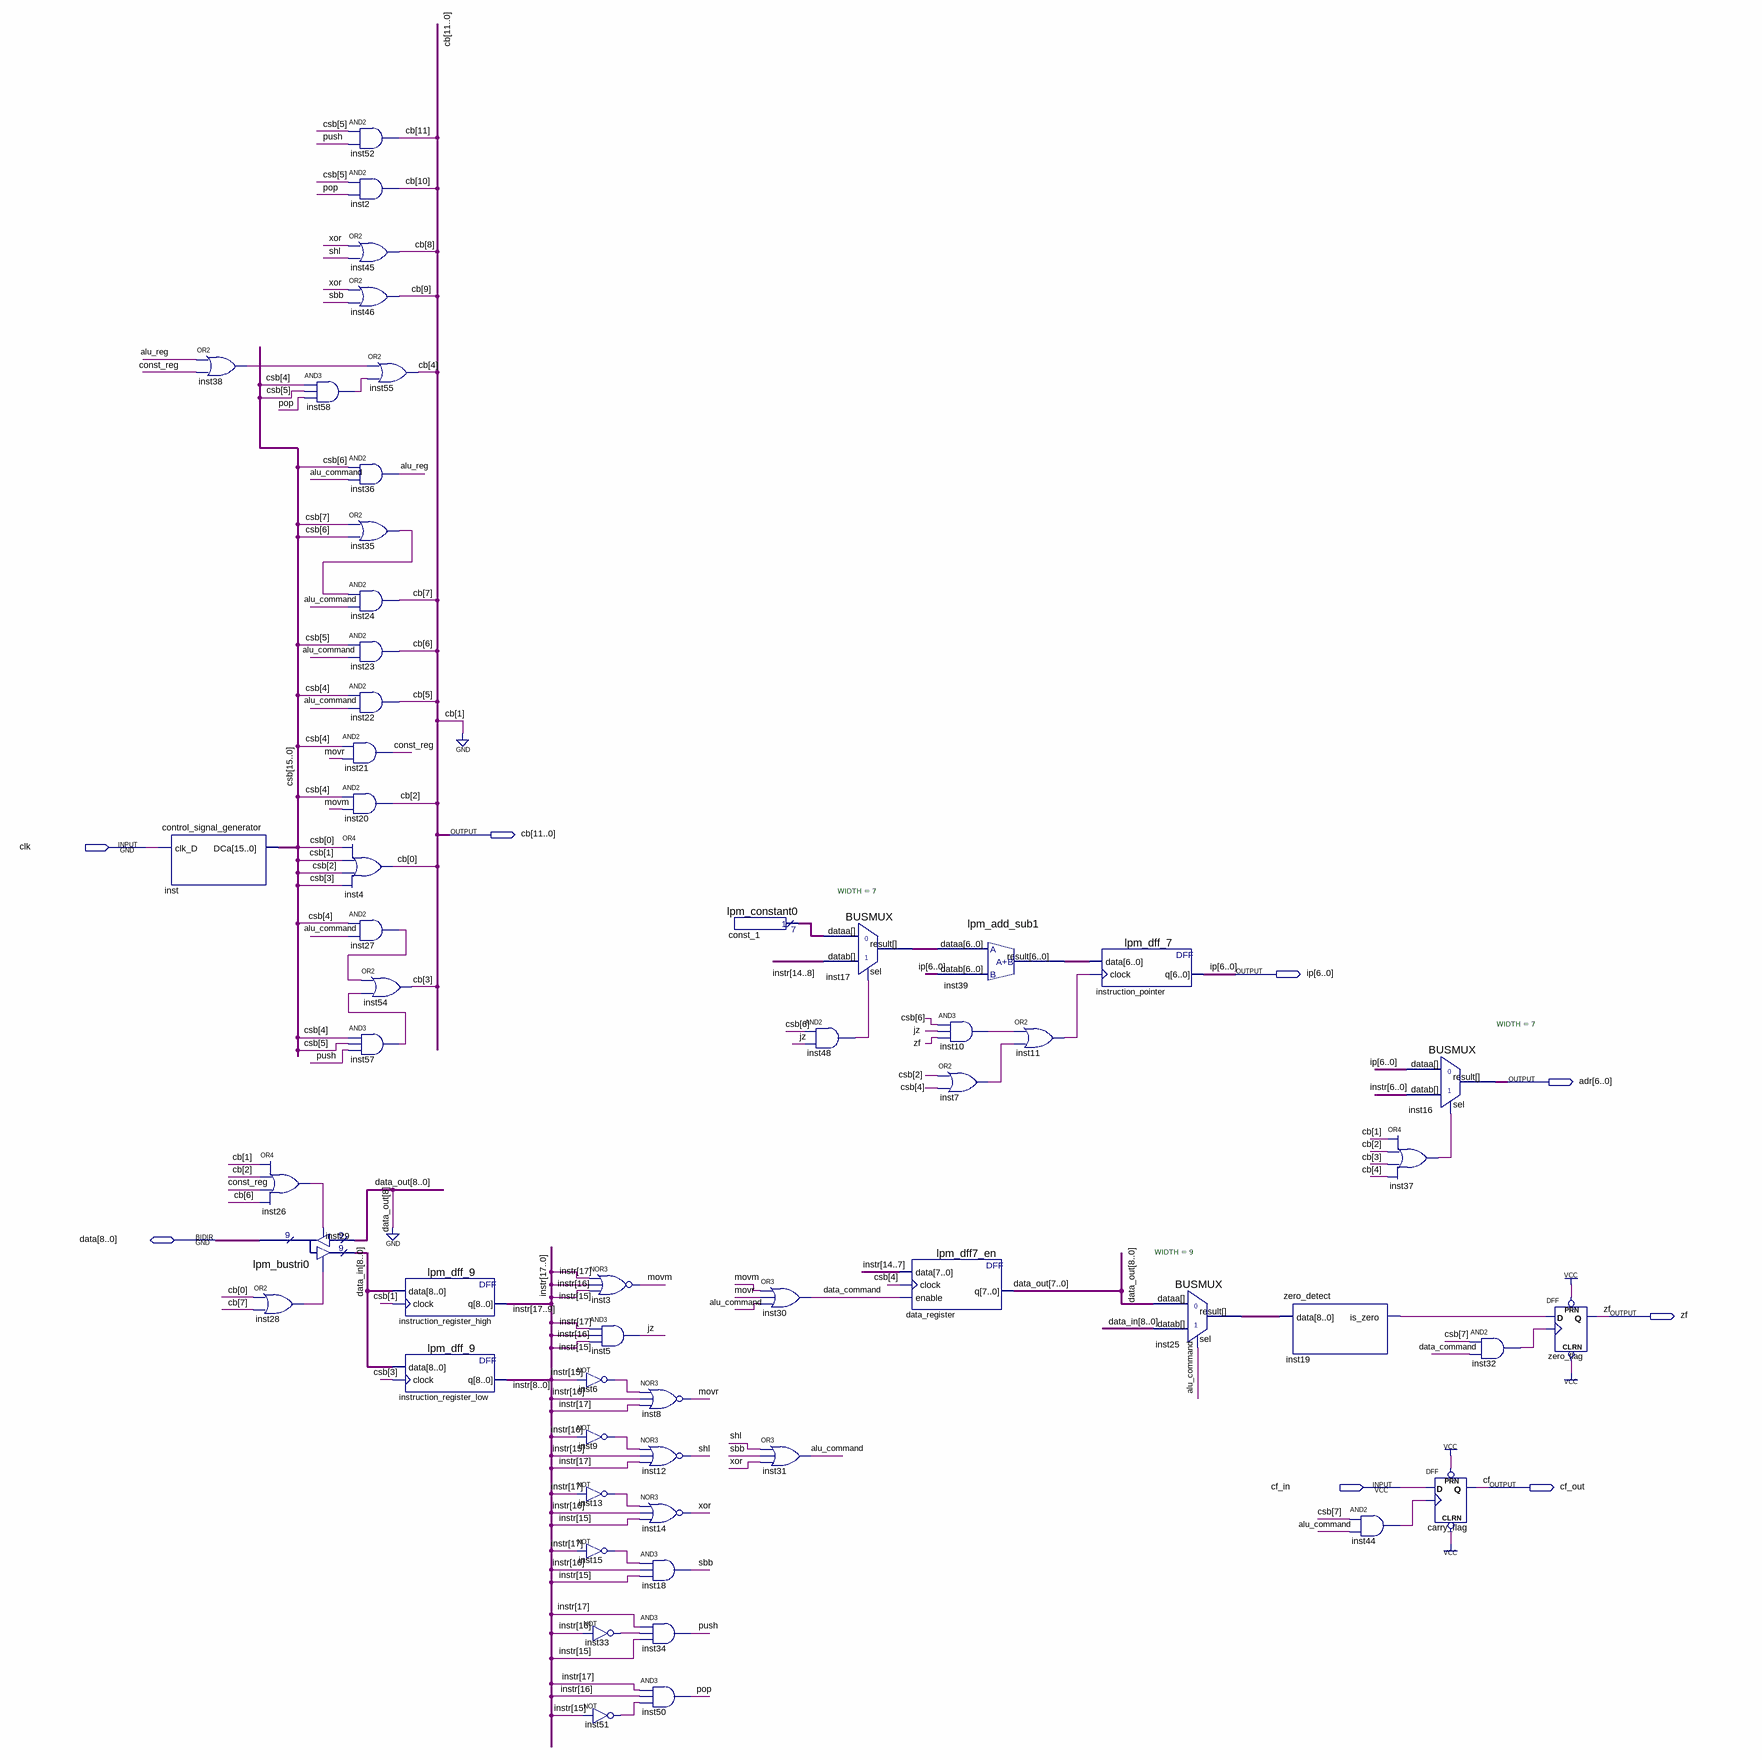
[diagram p0: schematic sheet]
// Quartus schematic control_unit.bdf as structural Verilog: 57 symbols, 8 pins
module control_unit (
  input  clk,
  input  cf_in,
  inout  [8:0] data,
  output [11:0] cb,
  output [6:0] ip,
  output [6:0] adr,
  output zf,
  output cf_out
);

  wire alu_command, alu_reg, const_reg, data_command, inst6_out, inst7_out, inst9_out, inst10_out,
       inst11_out, inst13_out, inst15_out, inst19_is_zero, inst26_out, inst27_out, inst28_out, inst32_out,
       inst33_out, inst35_out, inst37_out, inst38_out, inst44_out, inst48_out, inst51_out, inst57_out,
       inst58_out, jz, movm, movr, pop, push, sbb, shl, \xor ;
  wire [6:0] const_1_result, inst17_result, inst39_result;
  wire [7:0] data_out;
  wire [8:0] data_in, inst25_result;
  wire [15:0] csb;
  wire [17:0] instr;

  control_signal_generator inst (.clk_D(clk), .DCa(csb));
  or inst38 (inst38_out, alu_reg, const_reg);
  or inst26 (inst26_out, 1'b0, cb[2], const_reg, cb[6]);
  lpm_bustri0 inst29 (
    .enabledt(inst26_out), .data({1'b0, data_out}), .enabletr(inst28_out), .result(data_in), .tridata(data));
  or inst28 (inst28_out, cb[0], cb[7]);
  and inst58 (inst58_out, csb[4], csb[5], pop);
  and inst52 (cb[11], csb[5], push);
  and inst2 (cb[10], csb[5], pop);
  or inst45 (cb[8], \xor , shl);
  or inst46 (cb[9], \xor , sbb);
  or inst55 (cb[4], inst38_out, inst58_out);
  and inst36 (alu_reg, csb[6], alu_command);
  or inst35 (inst35_out, csb[7], csb[6]);
  and inst24 (cb[7], inst35_out, alu_command);
  and inst23 (cb[6], csb[5], alu_command);
  and inst22 (cb[5], csb[4], alu_command);
  and inst21 (const_reg, csb[4], movr);
  and inst20 (cb[2], csb[4], movm);
  or inst4 (cb[0], csb[0], csb[1], csb[2], csb[3]);
  and inst27 (inst27_out, csb[4], alu_command);
  or inst54 (cb[3], inst27_out, inst57_out);
  and inst57 (inst57_out, csb[4], csb[5], push);
  lpm_dff_9 instruction_register_high (.data(data_in), .clock(csb[1]), .q(instr[17:9]));
  lpm_dff_9 instruction_register_low (.data(data_in), .clock(csb[3]), .q(instr[8:0]));
  nor inst3 (movm, instr[17], instr[16], instr[15]);
  and inst5 (jz, instr[17], instr[16], instr[15]);
  not inst6 (inst6_out, instr[15]);
  not inst9 (inst9_out, instr[16]);
  not inst13 (inst13_out, instr[17]);
  not inst15 (inst15_out, instr[17]);
  not inst33 (inst33_out, instr[16]);
  not inst51 (inst51_out, instr[15]);
  nor inst8 (movr, inst6_out, instr[16], instr[17]);
  nor inst12 (shl, inst9_out, instr[15], instr[17]);
  nor inst14 (\xor , inst13_out, instr[16], instr[15]);
  and inst18 (sbb, inst15_out, instr[16], instr[15]);
  and inst34 (push, instr[17], inst33_out, instr[15]);
  and inst50 (pop, instr[17], instr[16], inst51_out);
  lpm_constant0 const_1 (.result(const_1_result));
  or inst30 (data_command, movm, movr, alu_command);
  or inst31 (alu_command, shl, sbb, \xor );
  BUSMUX #(.WIDTH(7)) inst17 (.datab(instr[14:8]), .sel(inst48_out), .dataa(const_1_result), .result(inst17_result));
  and inst48 (inst48_out, csb[6], jz);
  lpm_dff7_en data_register (.data(instr[14:7]), .clock(csb[4]), .enable(data_command), .q(data_out));
  lpm_add_sub1 inst39 (.dataa(inst17_result), .datab(ip), .result(inst39_result));
  and inst10 (inst10_out, csb[6], jz, zf);
  or inst7 (inst7_out, csb[2], csb[4]);
  or inst11 (inst11_out, inst10_out, inst7_out);
  lpm_dff_7 instruction_pointer (.data(inst39_result), .clock(inst11_out), .q(ip));
  BUSMUX #(.WIDTH(9)) inst25 (.datab(data_in), .sel(alu_command), .dataa({1'b0, data_out}), .result(inst25_result));
  zero_detect inst19 (.data(inst25_result), .is_zero(inst19_is_zero));
  and inst44 (inst44_out, csb[7], alu_command);
  BUSMUX #(.WIDTH(7)) inst16 (.datab(instr[6:0]), .sel(inst37_out), .dataa(ip), .result(adr));
  or inst37 (inst37_out, 1'b0, cb[2], cb[3], cb[4]);
  DFF carry_flag (.CLRN(1'b1), .CLK(inst44_out), .D(cf_in), .PRN(1'b1), .Q(cf_out));
  and inst32 (inst32_out, csb[7], data_command);
  DFF zero_flag (.CLRN(1'b1), .CLK(inst32_out), .D(inst19_is_zero), .PRN(1'b1), .Q(zf));

  assign cb[1] = 1'b0;

  // Other names for the same wires on the sheet: cf = cf_out
endmodule
